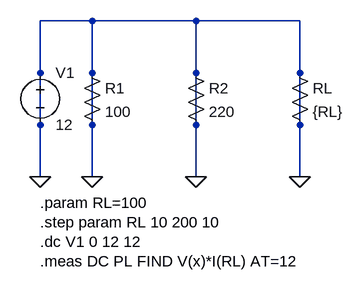
[diagram p0: schematic Ex11.asc]
Ex11.asc, the LTspice schematic file:
Version 4
SHEET 1 1680 1080
WIRE 160 160 80 160
WIRE 320 160 160 160
WIRE 480 160 320 160
WIRE 480 240 480 160
WIRE 320 240 320 160
WIRE 160 240 160 160
WIRE 80 240 80 160
WIRE 80 320 80 240
WIRE 160 320 160 240
WIRE 320 320 320 240
WIRE 480 320 480 240
WIRE 80 400 80 320
WIRE 160 400 160 320
WIRE 320 400 320 320
WIRE 480 400 480 320
FLAG 80 400 0
FLAG 160 400 0
FLAG 320 400 0
FLAG 480 400 0
SYMBOL voltage 80 224 R0
WINDOW 123 0 0 Left 0
WINDOW 39 0 0 Left 0
SYMATTR InstName V1
SYMATTR Value 12
SYMBOL res 144 224 R0
SYMATTR InstName R1
SYMATTR Value 100
SYMBOL res 304 224 R0
SYMATTR InstName R2
SYMATTR Value 220
SYMBOL res 464 224 R0
SYMATTR InstName RL
SYMATTR Value {RL}
TEXT 80 440 Left 2 !.param RL=100
TEXT 80 470 Left 2 !.step param RL 10 200 10
TEXT 80 500 Left 2 !.dc V1 0 12 12
TEXT 80 530 Left 2 !.meas DC PL FIND V(x)*I(RL) AT=12
NET 320 160 x

The netlist it stands for:
* Ex11.asc
V1 0 0 12
R1 0 0 100
R2 0 0 220
RL 0 0 {RL}
.param RL=100
.step param RL 10 200 10
.dc V1 0 12 12
.meas DC PL FIND V(x)*I(RL) AT=12
.backanno
.end